# Altium schematic sheet Current sensor circuit.SchDoc
size A; SheetNumber: 4; SheetTotal: 6
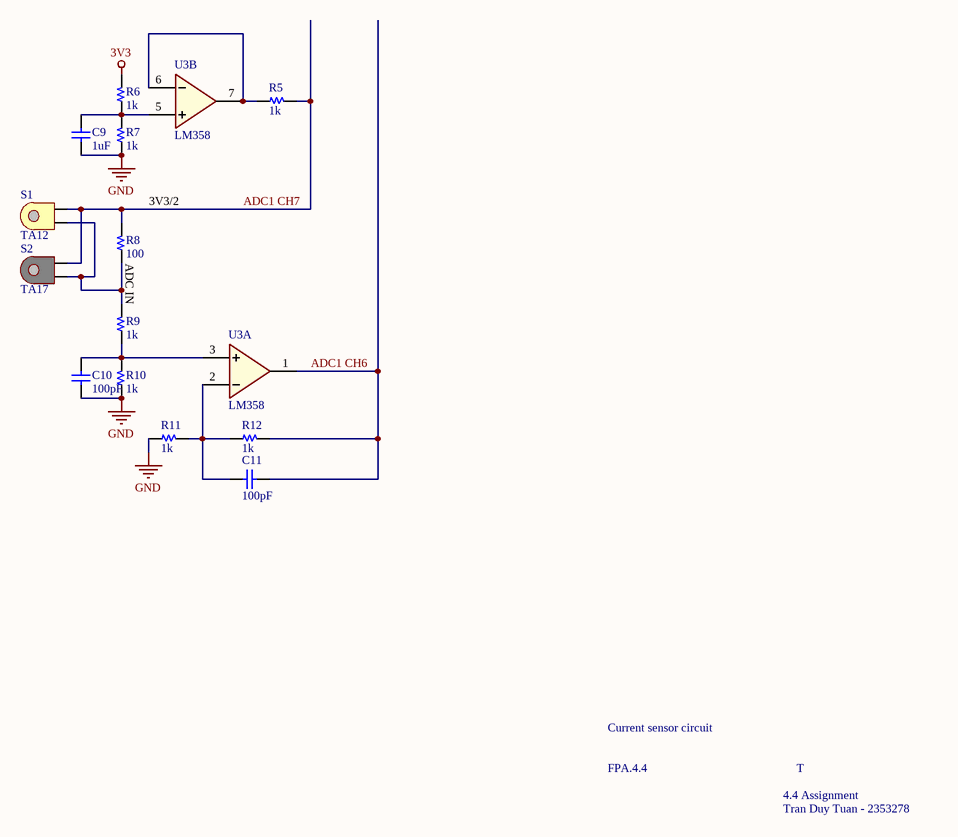
[diagram p0: Current sensor circuit.SchDoc]

## Parts
C9  1uF  [C 0805]
C10  100pF  [C 0805]
C11  100pF  [C 0805]
R5  1k  [R 0805]
R6  1k  [R 0805]
R7  1k  [R 0805]
R8  100  [R 0805]
R9  1k  [R 0805]
R10  1k  [R 0805]
R11  1k  [R 0805]
R12  1k  [R 0805]
S1  TA12  [TA12]
S2  TA17  [TA17]
U3  LM358  [SOIC-8]  (parts A,B of 2)

## Nets
3V3: R6.2
GND: C9.2 C10.2 R7.1 R10.1 R11.1 U3.4(GND)
VCC: U3.8(VCC)
ADC1 CH6: C11.2 R12.2 U3.1(OutA)
ADC1 CH7: R5.2 R8.2 S1.1 S2.1
NetC9_1: C9.1 R6.1 R7.2 U3.5(B+)
NetC10_1: C10.1 R9.1 R10.2 U3.3(A+)
NetC11_1: C11.1 R11.2 R12.1 U3.2(A-)
NetR5_1: R5.1 U3.6(B-) U3.7(OutB)
NetR8_1: R8.1 R9.2 S1.2 S2.2

## Notes on the sheet
- ADC IN
- 3V3/2
- Current sensor circuit
- FPA.4.4
- 4.4 Assignment
- T
- Tran Duy Tuan - 2353278

## Library data of the parts
C9-C11 = Capacitor NP: Capacitor non-pol
R5-R12 = Resistor
U3 = LM358: Low Power Dual Operational Amplifiers